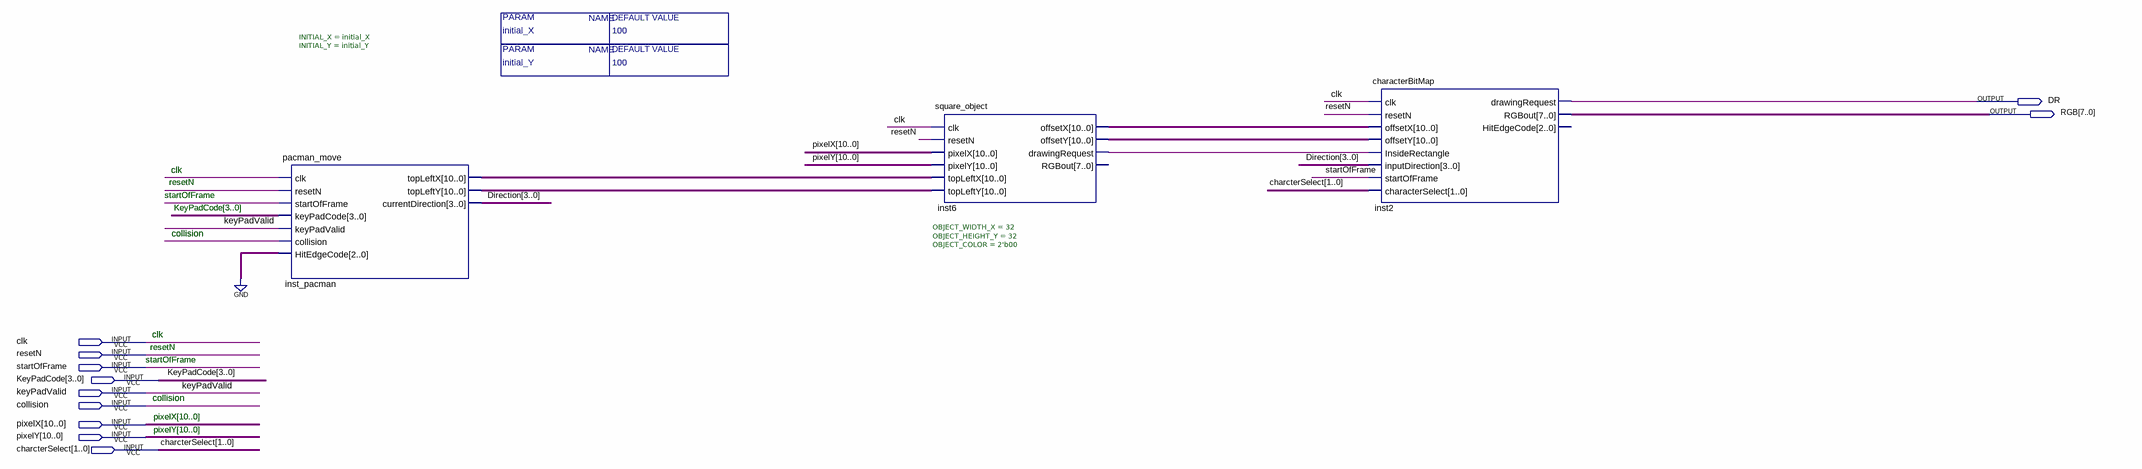
[diagram p0: schematic sheet]
// Quartus schematic Character.bdf as structural Verilog: 3 symbols, 11 pins
module Character #(parameter initial_X = 100, parameter initial_Y = 100) (
  input  clk,
  input  resetN,
  input  startOfFrame,
  input  [3:0] KeyPadCode,
  input  keyPadValid,
  input  collision,
  input  [10:0] pixelX,
  input  [10:0] pixelY,
  input  [1:0] charcterSelect,
  output DR,
  output [7:0] RGB
);

  wire inst6_drawingrequest;
  wire [3:0] Direction;
  wire [10:0] inst6_offsetx, inst6_offsety, inst_pacman_topleftx, inst_pacman_toplefty;

  pacman_move #(.INITIAL_X(initial_X), .INITIAL_Y(initial_Y)) inst_pacman (
    .clk(clk), .resetN(resetN), .startOfFrame(startOfFrame), .keyPadCode(KeyPadCode),
    .keyPadValid(keyPadValid), .collision(collision), .HitEdgeCode(3'b000), .topLeftX(inst_pacman_topleftx),
    .topLeftY(inst_pacman_toplefty), .currentDirection(Direction));
  square_object #(.OBJECT_WIDTH_X(32), .OBJECT_HEIGHT_Y(32), .OBJECT_COLOR(2'b00)) inst6 (
    .clk(clk), .resetN(resetN), .pixelX(pixelX), .pixelY(pixelY), .topLeftX(inst_pacman_topleftx),
    .topLeftY(inst_pacman_toplefty), .offsetX(inst6_offsetx), .offsetY(inst6_offsety),
    .drawingRequest(inst6_drawingrequest));  // open: RGBout
  characterBitMap inst2 (
    .clk(clk), .resetN(resetN), .offsetX(inst6_offsetx), .offsetY(inst6_offsety),
    .InsideRectangle(inst6_drawingrequest), .inputDirection(Direction), .startOfFrame(startOfFrame),
    .characterSelect(charcterSelect), .drawingRequest(DR), .RGBout(RGB));  // open: HitEdgeCode

  // Notes on the sheet:
  //   clk
  //   resetN
  //   startOfFrame
  //   KeyPadCode[3..0]
  //   collision 
  //   clk
  //   resetN
  //   startOfFrame
  //   collision 
  //   pixelX[10..0]
  //   pixelY[10..0]
endmodule
